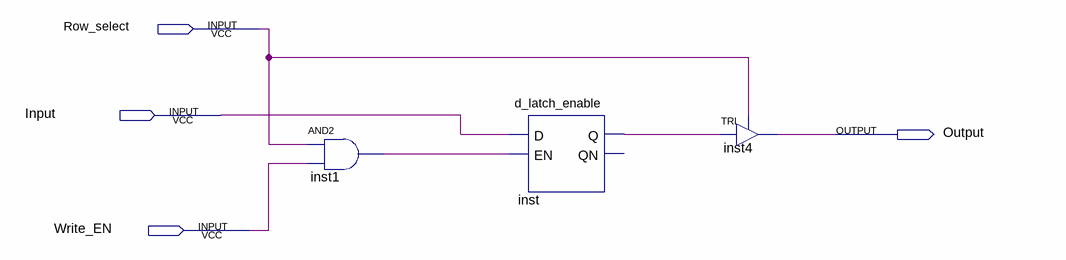
[diagram p0: schematic sheet]
// Quartus schematic memory_cell.bdf as structural Verilog: 3 symbols, 4 pins
module memory_cell (
  input  Row_select,
  input  Input,
  input  Write_EN,
  output Output
);

  wire inst1_out, inst_q;

  and inst1 (inst1_out, Row_select, Write_EN);
  d_latch_enable inst (.D(Input), .EN(inst1_out), .Q(inst_q));  // open: QN
  TRI inst4 (.IN(inst_q), .OE(Row_select), .OUT(Output));
endmodule
